# Altium schematic sheet GSM_Sheet.SchDoc (part 1 of 3)
size 420 x 297 mm
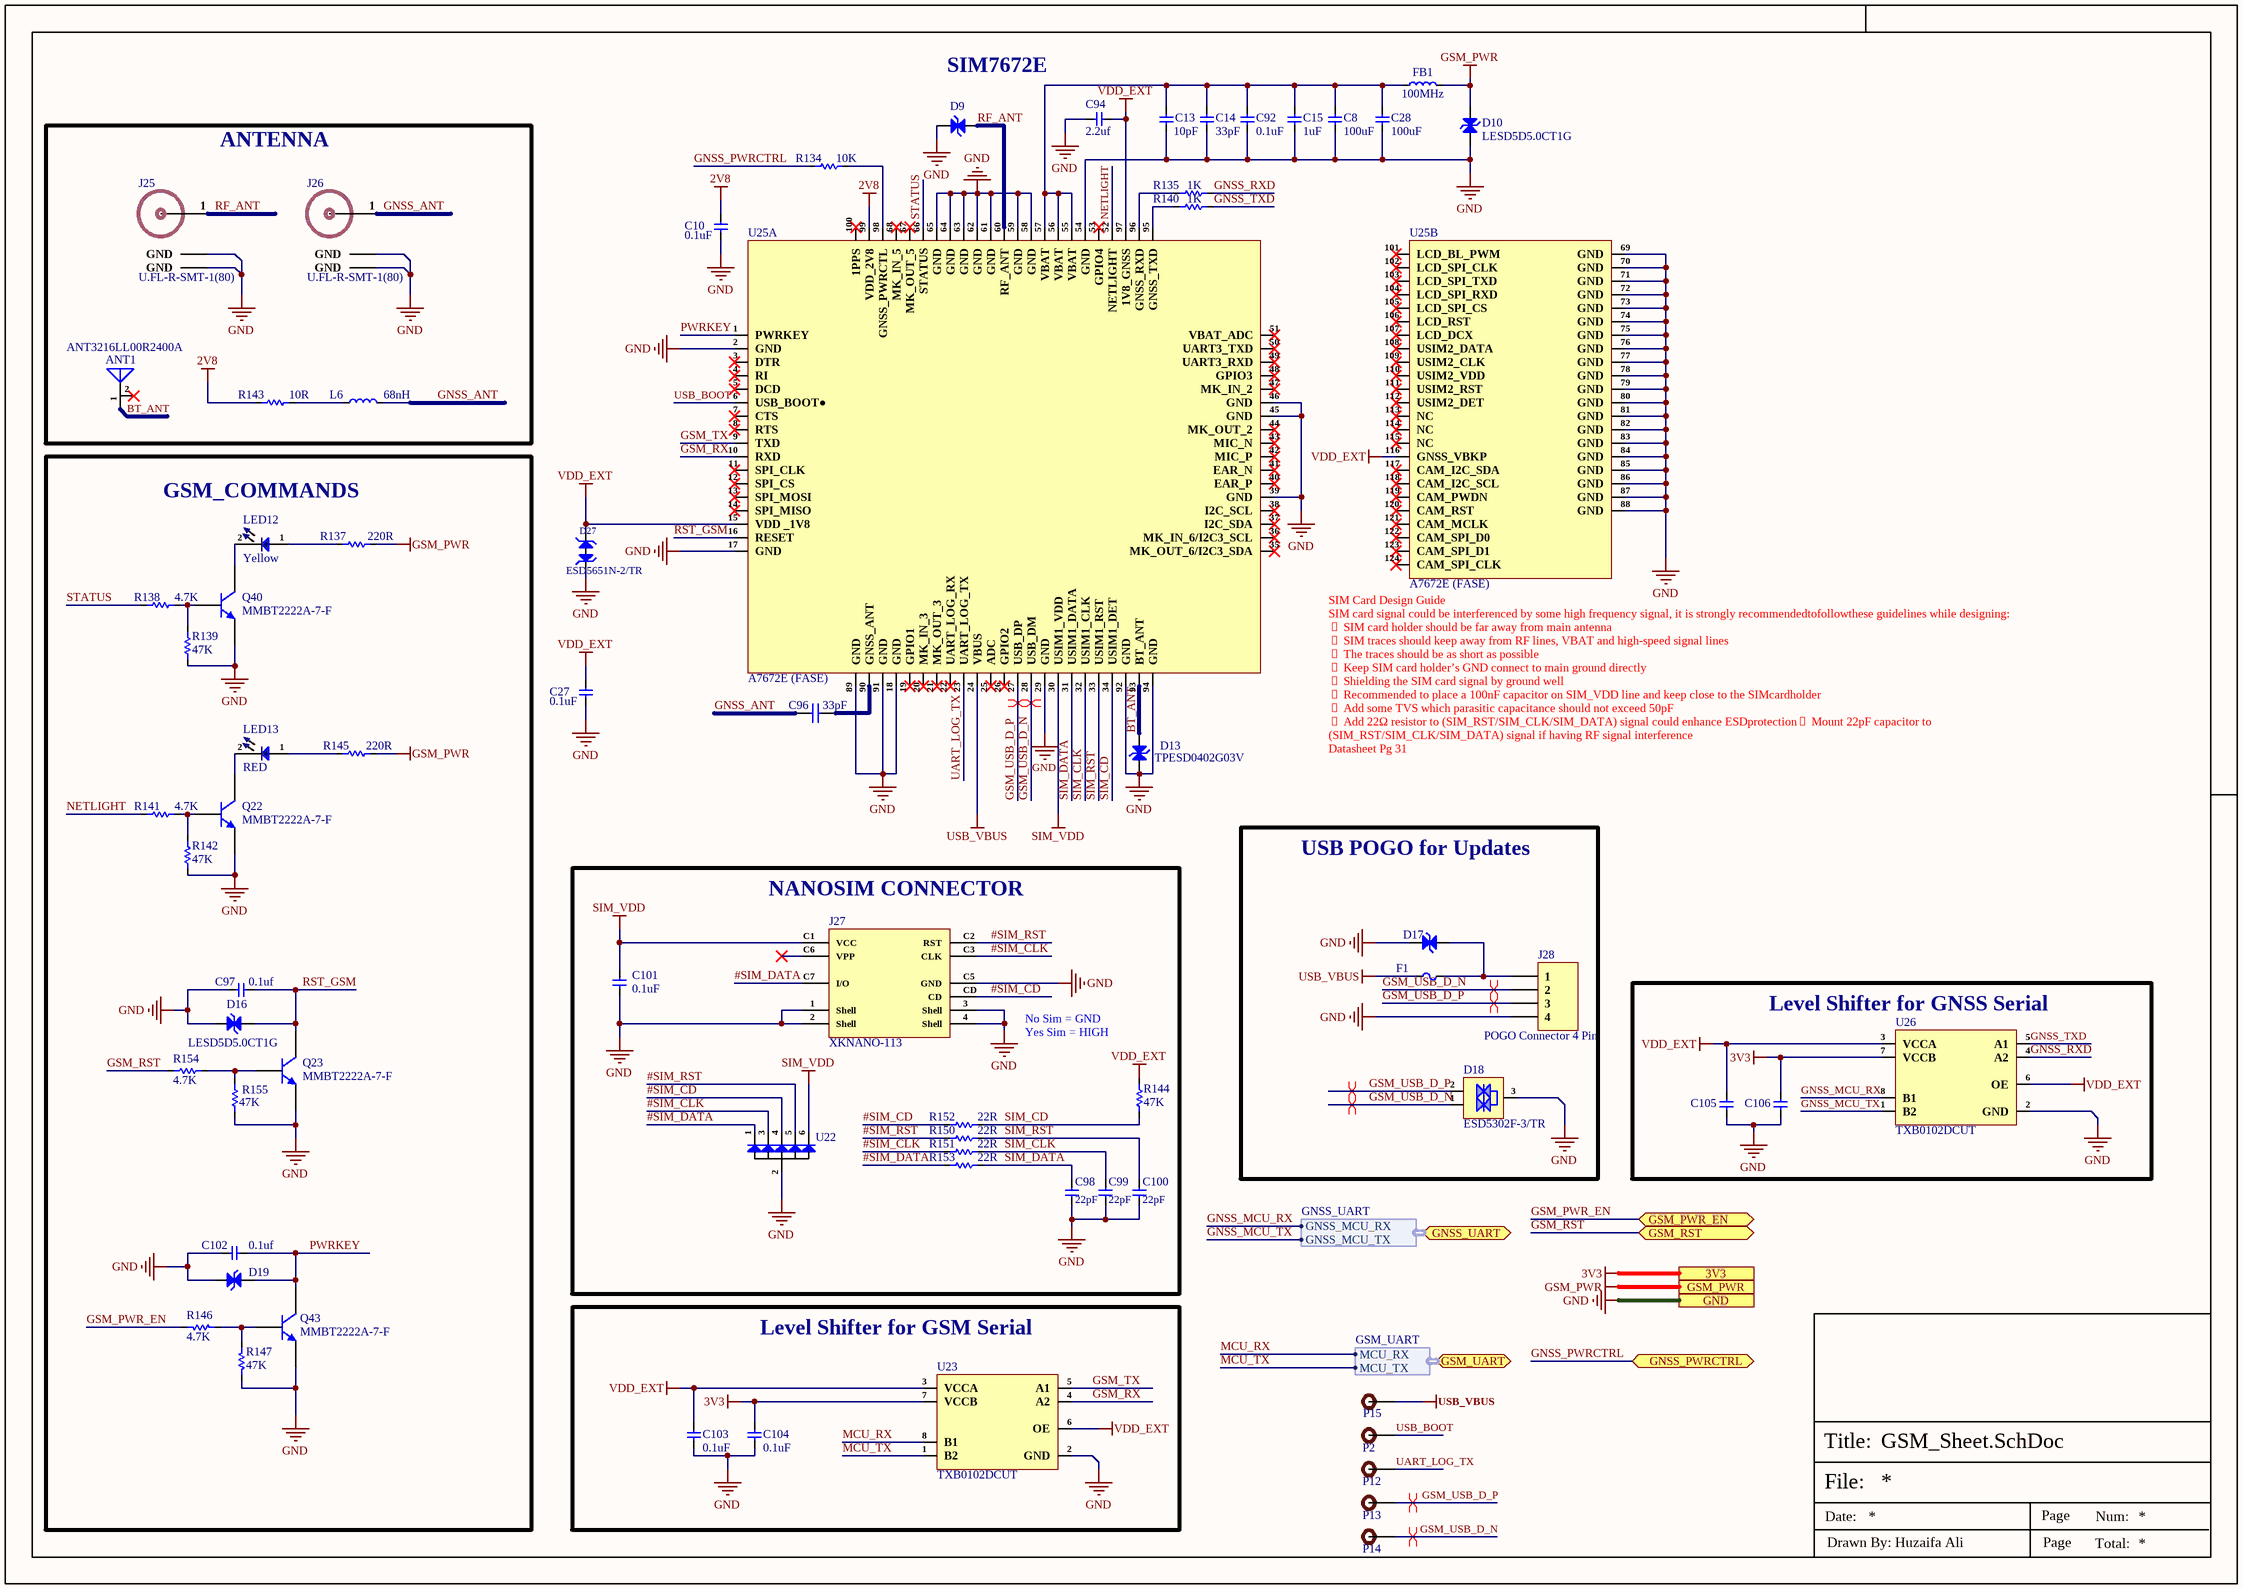
[diagram p0: GSM_Sheet.SchDoc]

## Parts
ANT1  ANT3216LL00R2400A  [ANT3216LL00R2400A]
C8  100uF  [Cap-1206]
C10  0.1uF  [CAP-0201]
C13  10pF  [Cap-0402]
C14  33pF  [Cap-0402]
C15  1uF  [Cap-0402]
C27  0.1uF  [CAP-0201]
C28  100uF  [Cap-1206]
C92  0.1uF  [Cap-0402]
C94  2.2uf  [Cap-0402]
C96  33pF  [Cap-0402]
C97  0.1uf  [Cap-0402]
C98  22pF  [CAP-0201]
C99  22pF  [CAP-0201]
C100  22pF  [CAP-0201]
C101  0.1uF  [CAP-0201]
C102  0.1uf  [Cap-0402]
C103  0.1uF  [CAP-0201]
C104  0.1uF  [CAP-0201]
C105  (no value)  [CAP-0201]
C106  (no value)  [CAP-0201]
D9  TPESD0402G03V  [TPESD0402G03V]  (value not drawn)
D10  LESD5D5.0CT1G  [SOD-523]
D13  TPESD0402G03V  [TPESD0402G03V]
D16  LESD5D5.0CT1G  [SOD-523]
D17  PESD5V0H1BSFYL  [DSN0603-2]  (value not drawn)
D18  ESD5302F-3/TR  [Sot-23]
D19  LESD5D5.0CT1G  [SOD-523]  (value not drawn)
D27  ESD5651N-2/TR  [DFN1006-2L_]
F1  SMD0603-050  [Fuse-0603]  (value not drawn)
FB1  100MHz  [Ind-0805]
J25  U.FL-R-SMT-1(80)  [U.FL-R-SMT-1(80)_]
J26  U.FL-R-SMT-1(80)  [U.FL-R-SMT-1(80)_]
J27  XKNANO-113  [XKNANO-113]
J28  POGO Connector 4 Pin  [Pogo 4 Pin]
L6  68nH  [IND-0603 (1608 Metric)]
LED12  Yellow  [LED-0603]
LED13  RED  [LED-0603]
P2  TEST POINT  [Test-point]  (value not drawn)
P12  TEST POINT  [Test-point]  (value not drawn)
P13  TEST POINT  [Test-point]  (value not drawn)
P14  TEST POINT  [Test-point]  (value not drawn)
P15  TEST POINT  [Test-point]  (value not drawn)
Q22  MMBT2222A-7-F  [SOT-23]
Q23  MMBT2222A-7-F  [SOT-23]
Q40  MMBT2222A-7-F  [SOT-23]
Q43  MMBT2222A-7-F  [SOT-23]
R134  10K  [Res-0402]
R135  1K  [Res-0201]
R137  220R  [Res-0603]
R138  4.7K  [Res-0402]
R139  47K  [Res-0402]
R140  1K  [Res-0201]
R141  4.7K  [Res-0402]
R142  47K  [Res-0402]
R143  10R  [Res-0402]
R144  47K  [Res-0402]
R145  220R  [Res-0603]
R146  4.7K  [Res-0402]
R147  47K  [Res-0402]
R150  22R  [Res-0201]
R151  22R  [Res-0201]
R152  22R  [Res-0201]
R153  22R  [Res-0201]
R154  4.7K  [Res-0402]
R155  47K  [Res-0402]
U22  SMF05CT1G-ES  [SOT-363]  (value not drawn)
U23  TXB0102DCUT  [TXB0102DCUT]
U25  A7672E (FASE)  [A7672E (FASE)]  (parts A,B of 2)
U26  TXB0102DCUT  [TXB0102DCUT]

## Blocks framed on the sheet
ANTENNA: ANT1 J25 J26 L6 R143
GSM_COMMANDS: C97 C102 D16 D19 LED12 LED13 Q22 Q23 Q40 Q43 R137-R139 R141 R142 R145-R147 R154 R155
USB POGO for Updates: D17 D18 F1 J28
NANOSIM CONNECTOR: C98-C101 J27 R144 R150-R153 U22
Level Shifter for GNSS Serial: C105 C106 U26
Level Shifter for GSM Serial: C103 C104 U23

## Ports
3V3, GND, GNSS_PWRCTRL (bidir), GNSS_UART (bidir, harness GNSS_UART), GSM_PWR, GSM_PWR_EN (bidir), GSM_RST (bidir), GSM_UART (bidir, harness GSM_UART)

## Harnesses
GSM_UART: MCU_RX, MCU_TX
GNSS_UART: GNSS_MCU_RX, GNSS_MCU_TX

## Nets
2V8: C10.1 R143.1 U25.99(VDD_2V8)
3V3: C104.1 C106.1 U23.7(VCCB) U26.7(VCCB) ; port 3V3
GND: C8.1 C10.2 C13.1 C14.1 C15.1 C27.2 C28.1 C92.1 C94.2 C97.1 C98.1 C99.1 C100.1 C101.2 C102.1 C103.2 C104.2 C105.2 C106.2 D9.1(A) D10.1(A) D13.1(A) D16.2(A) D17.1(A) D18.3(GND) D19.2(A) D27.1(K) J25.2(GND) J25.3(GND) J26.2(GND) J26.3(GND) J27.1(Shell) J27.2(Shell) J27.3(Shell) J27.4(Shell) J27.C5(GND) J28.4 Q22.2(E) Q23.2(E) Q40.2(E) Q43.2(E) R139.1 R142.1 R147.1 R155.1 U22.2(A) U23.2(GND) U25.2(GND) U25.17(GND) U25.18(GND) U25.29(GND) U25.39(GND) U25.45(GND) U25.46(GND) U25.54(GND) U25.58(GND) U25.59(GND) U25.61(GND) U25.62(GND) U25.63(GND) U25.64(GND) U25.65(GND) U25.69(GND) U25.70(GND) U25.71(GND) U25.72(GND) U25.73(GND) U25.74(GND) U25.75(GND) U25.76(GND) U25.77(GND) U25.78(GND) U25.79(GND) U25.80(GND) U25.81(GND) U25.82(GND) U25.83(GND) U25.84(GND) U25.85(GND) U25.86(GND) U25.87(GND) U25.88(GND) U25.89(GND) U25.91(GND) U25.92(GND) U25.94(GND) U26.2(GND) ; port GND
GSM_PWR: D10.2(A) FB1.2 R137.2 R145.2 ; port GSM_PWR
SIM_VDD: C101.1 J27.C1(VCC) U22.6(IO5) U25.30(USIM1_VDD)
USB_VBUS: F1.1 P15.1 U25.24(VBUS)
VDD_EXT: C27.1 C94.1 C103.1 C105.1 D27.2(K) R144.1 U23.3(VCCA) U23.6(OE) U25.15(VDD__1V8) U25.97(1V8_GNSS) U25.116(GNSS_VBKP) U26.3(VCCA) U26.6(OE)
#SIM_CD: J27.CD R152.1 U22.4(IO3)
#SIM_CLK: J27.C3(CLK) R151.1 U22.3(IO2)
#SIM_DATA: J27.C7(I/O) R153.1 U22.1(IO1)
#SIM_RST: J27.C2(RST) R150.1 U22.5(IO4)
BT_ANT: ANT1.1(Feed) D13.2(A) U25.93(BT_ANT)
GNSS_ANT: C96.2 J26.1(RF_IN) L6.2
GNSS_MCU_RX: U26.8(B1) ; port GNSS_UART.GNSS_MCU_RX
GNSS_MCU_TX: U26.1(B2) ; port GNSS_UART.GNSS_MCU_TX
GNSS_PWRCTRL: R134.2 ; port GNSS_PWRCTRL
GNSS_RXD: R135.2 U26.4(A2)
GNSS_TXD: R140.2 U26.5(A1)
GSM_PWR_EN: R146.2 ; port GSM_PWR_EN
GSM_RST: R154.1 ; port GSM_RST
GSM_RX: U23.4(A2) U25.10(RXD)
GSM_TX: U23.5(A1) U25.9(TXD)
GSM_USB_D_N: D18.1(I/O1) J28.2 P14.1 U25.28(USB_DM)
GSM_USB_D_P: D18.2(I/O2) J28.3 P13.1 U25.27(USB_DP)
MCU_RX: U23.8(B1) ; port GSM_UART.MCU_RX
MCU_TX: U23.1(B2) ; port GSM_UART.MCU_TX
NETLIGHT: R141.1 U25.52(NETLIGHT)
PWRKEY: C102.2 D19.1(A) Q43.3(C) U25.1(PWRKEY)
RF_ANT: D9.2(A) J25.1(RF_IN) U25.60(RF_ANT)
RST_GSM: C97.2 D16.1(A) Q23.3(C) U25.16(RESET)
SIM_CD: R144.2 R152.2 U25.34(USIM1_DET)
SIM_CLK: C99.2 R151.2 U25.32(USIM1_CLK)
SIM_DATA: C98.2 R153.2 U25.31(USIM1_DATA)
SIM_RST: C100.2 R150.2 U25.33(USIM1_RST)
STATUS: R138.1 U25.66(STATUS)
UART_LOG_TX: P12.1 U25.23(UART_LOG_TX)
USB_BOOT: P2.1 U25.6(USB_BOOT●)
NetC8_2: C8.2 C13.2 C14.2 C15.2 C28.2 C92.2 FB1.1 U25.55(VBAT) U25.56(VBAT) U25.57(VBAT)
NetC96_1: C96.1 U25.90(GNSS_ANT)
NetD17_2: D17.2(A) F1.2 J28.1
NetL6_1: L6.1 R143.2
NetLED12_1: LED12.1 R137.1
NetLED12_2: LED12.2 Q40.3(C)
NetLED13_1: LED13.1 R145.1
NetLED13_2: LED13.2 Q22.3(C)
NetQ22_1: Q22.1(B) R141.2 R142.2
NetQ23_1: Q23.1(B) R154.2 R155.2
NetQ40_1: Q40.1(B) R138.2 R139.2
NetQ43_1: Q43.1(B) R146.1 R147.2
NetR134_1: R134.1 U25.98(GNSS_PWRCTL)
NetR135_1: R135.1 U25.96(GNSS_RXD)
NetR140_1: R140.1 U25.95(GNSS_TXD)

Not connected (* = marked no-connect by the designer): ANT1 2(NC)*; J27 C6(VPP)*; U25 3(DTR)* 4(RI)* 5(DCD)* 7(CTS)* 8(RTS)* 11(SPI_CLK)* 12(SPI_CS)* 13(SPI_MOSI)* 14(SPI_MISO)* 19(GPIO1)* 20(MK_IN_3)* 21(MK_OUT_3)* 22(UART_LOG_RX)* 25(ADC)* 26(GPIO2)* 35(MK_OUT_6/I2C3_SDA)* 36(MK_IN_6/I2C3_SCL)* 37(I2C_SDA)* 38(I2C_SCL)* 40(EAR_P)* 41(EAR_N)* 42(MIC_P)* 43(MIC_N)* 44(MK_OUT_2)* 47(MK_IN_2)* 48(GPIO3)* 49(UART3_RXD)* 50(UART3_TXD)* 51(VBAT_ADC)* 53(GPIO4)* 67(MK_OUT_5)* 68(MK_IN_5)* 100(1PPS)* 101(LCD_BL_PWM)* 102(LCD_SPI_CLK)* 103(LCD_SPI_TXD)* 104(LCD_SPI_RXD)* 105(LCD_SPI_CS)* 106(LCD_RST)* 107(LCD_DCX)* 108(USIM2_DATA)* 109(USIM2_CLK)* 110(USIM2_VDD)* 111(USIM2_RST)* 112(USIM2_DET)* 113(NC)* 114(NC)* 115(NC)* 117(CAM_I2C_SDA)* 118(CAM_I2C_SCL)* 119(CAM_PWDN)* 120(CAM_RST)* 121(CAM_MCLK)* 122(CAM_SPI_D0)* 123(CAM_SPI_D1)* 124(CAM_SPI_CLK)*

## Layout directives
differential pair; net class GSM_USB; differential pair class GSM_USB_Lines; rule Impedance Constraint [Min = 88.00    Max = 90.00    ]; rule Matched Net Lengths [Tolerance = 20mil]: GSM_USB_D_N, GSM_USB_D_P
differential pair: GSM_USB_D_N, GSM_USB_D_P

## Notes on the sheet
- SIM7672E
- (near U25) SIM Card Design Guide
  SIM card signal could be interferenced by some high frequency signal, it is strongly recommendedtofollowthese guidelines while designing:
   SIM card holder should be far away from main antenna
   SIM traces should keep away from RF lines, VBAT and high-speed signal lines
   The traces should be as short as possible
   Keep SIM card holder’s GND connect to main ground directly
   Shielding the SIM card signal by ground well
   Recommended to place a 100nF capacitor on SIM_VDD line and keep close to the SIMcardholder
   Add some TVS which parasitic capacitance should not exceed 50pF
   Add 22Ω resistor to (SIM_RST/SIM_CLK/SIM_DATA) signal could enhance ESDprotection Mount 22pF capacitor to (SIM_RST/SIM_CLK/SIM_DATA) signal if having RF signal interference
  Datasheet Pg 31
- No Sim = GND
  Yes Sim = HIGH
- File:
- Title:
- Date:
- Page
- Num:
- Total:
- Drawn By: Huzaifa Ali